# Altium schematic sheet PowSwitchChannel.SchDoc
size A4; SheetNumber: 2; SheetTotal: 5
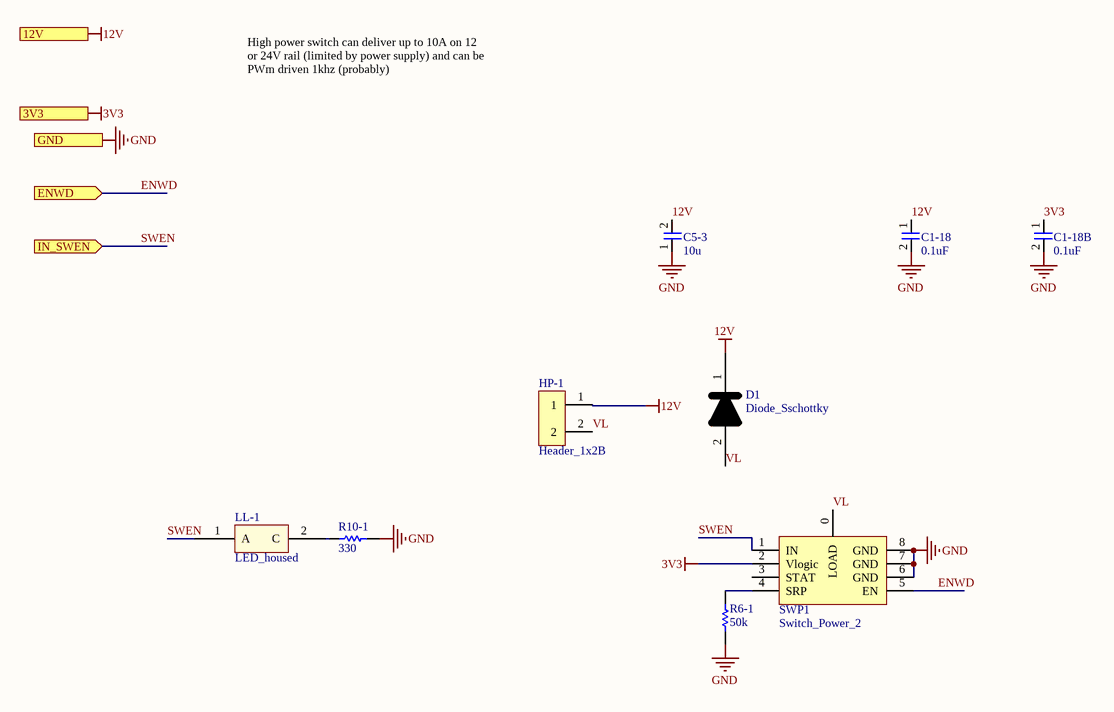
[diagram p0: PowSwitchChannel.SchDoc]

## Parts
C1-18  0.1uF  [0805]
C1-18B  0.1uF  [0805]
C5-3  10u  [1206]
D1  Diode_Sschottky  [SOD-123F]
HP-1  Header_1x2B  [Header_1x2B]
LL-1  LED_housed  [LED_Housed]
R6-1  50k  [0805]
R10-1  330  [0603]
SWP1  Switch_Power_2  [8-SOIC]

## Ports
3V3 (in), 12V (in), ENWD (in), GND (in), IN_SWEN (in)

## Nets
3V3: C1-18B.1 SWP1.2(Vlogic) ; port 3V3
12V: C1-18.1 C5-3.2(C1-1) D1.1(GND) HP-1.1 ; port 12V
GND: C1-18.2 C1-18B.2 C5-3.1 R6-1.1 R10-1.1 SWP1.6(GND) SWP1.7(GND) SWP1.8(GND) ; port GND
ENWD: SWP1.5(EN) ; port ENWD
SWEN: LL-1.1(A) SWP1.1(IN) ; port IN_SWEN
VL: D1.2(VCC) HP-1.2 SWP1.0(LOAD)
NetLL-1_2: LL-1.2(C) R10-1.2
NetR6-1_2: R6-1.2 SWP1.4(SRP)

Not connected (* = marked no-connect by the designer): SWP1 3(STAT)

## Notes on the sheet
- High power switch can deliver up to 10A on 12 or 24V rail (limited by power supply) and can be PWm driven 1khz (probably)

## Library data of the parts
C1-18 C1-18B = Capacitor1
C5-3 = Capacitor1205: Digikey P/N: 1276-6767-1-ND
R6-1 R10-1 = Res1: Resistor
  R6-1: Digikey P/N: 311-49.9KCRCT-ND
  R10-1: Digikey P/N: 311-330HRCT-ND
D1 = Diode_Sschottky: Digikey P/N: RBR3MM30ATFCT-ND
HP-1 = Header_1x2B: Digikey P/N: 277-5924-ND
LL-1 = LED_housed: Digikey P/N: 67-1083-ND, 67-1084-ND, 67-1082-ND
SWP1 = Switch_Power_2: Digikey P/N: 448-BTF3035EJXUMA1CT-ND